# Altium project NewTrackerMain.PrjPcb (part 1 of 6)
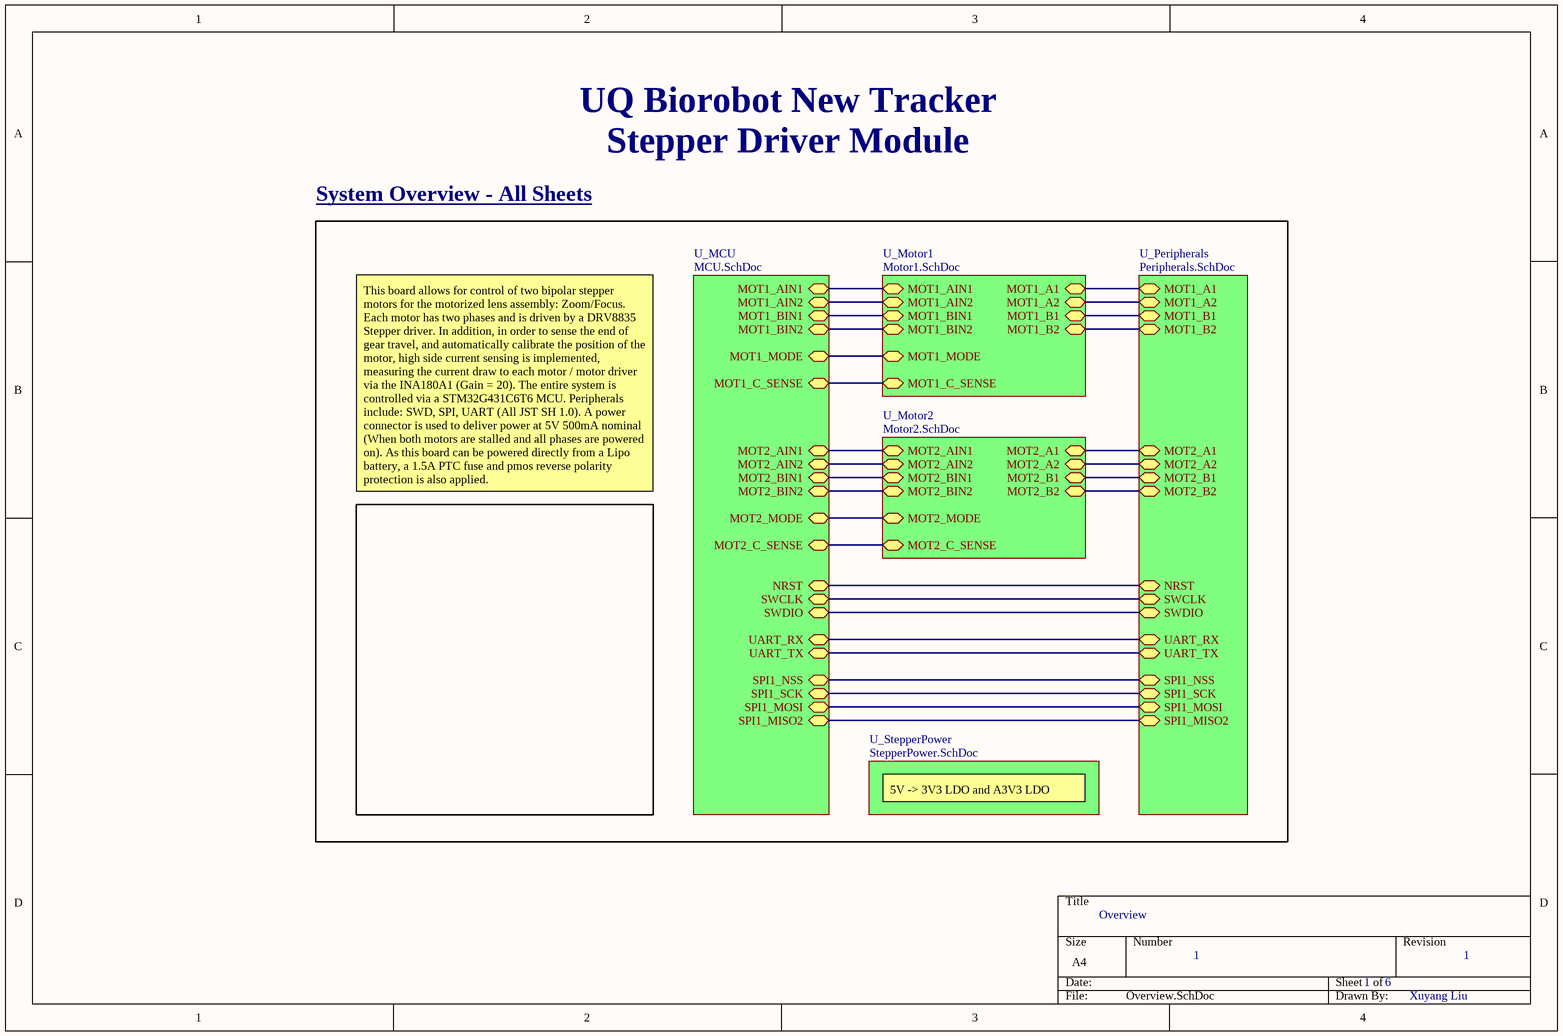
[diagram p0: Overview.SchDoc]
6 sheets, 68 parts. Net scope: hierarchical (ports join the sheet entries above them; power ports are global).
Board file: PCB2.PcbDoc
Sheets:
  Overview.SchDoc
    U_MCU = MCU.SchDoc
    U_Motor1 = Motor1.SchDoc
    U_Motor2 = Motor2.SchDoc
    U_Peripherals = Peripherals.SchDoc
    U_StepperPower = StepperPower.SchDoc

## Sheet Overview.SchDoc
size A4; SheetNumber: 1; SheetTotal: 6

### Sub-sheets
U_MCU = MCU.SchDoc: NRST (bidir), SPI1_SCK (bidir), SPI1_MOSI (bidir), SWDIO (bidir), SWCLK (bidir), UART_TX (bidir), UART_RX (bidir), SPI1_MISO2 (bidir), SPI1_NSS (bidir), MOT1_MODE (bidir), MOT1_AIN1 (bidir), MOT1_AIN2 (bidir), MOT1_BIN1 (bidir), MOT1_BIN2 (bidir), MOT2_AIN1 (bidir), MOT2_AIN2 (bidir), MOT2_BIN1 (bidir), MOT2_BIN2 (bidir), MOT2_MODE (bidir), MOT1_C_SENSE (bidir), MOT2_C_SENSE (bidir)
U_Motor1 = Motor1.SchDoc: MOT1_A1 (bidir), MOT1_A2 (bidir), MOT1_B1 (bidir), MOT1_B2 (bidir), MOT1_AIN1 (bidir), MOT1_AIN2 (bidir), MOT1_BIN1 (bidir), MOT1_BIN2 (bidir), MOT1_MODE (bidir), MOT1_C_SENSE (bidir)
U_Motor2 = Motor2.SchDoc: MOT2_A1 (bidir), MOT2_A2 (bidir), MOT2_B1 (bidir), MOT2_B2 (bidir), MOT2_AIN1 (bidir), MOT2_AIN2 (bidir), MOT2_BIN1 (bidir), MOT2_BIN2 (bidir), MOT2_MODE (bidir), MOT2_C_SENSE (bidir)
U_Peripherals = Peripherals.SchDoc: SWDIO (bidir), SWCLK (bidir), NRST (bidir), UART_TX (bidir), UART_RX (bidir), SPI1_NSS (bidir), SPI1_SCK (bidir), SPI1_MOSI (bidir), SPI1_MISO2 (bidir), MOT1_A1 (bidir), MOT1_A2 (bidir), MOT1_B1 (bidir), MOT1_B2 (bidir), MOT2_A1 (bidir), MOT2_A2 (bidir), MOT2_B1 (bidir), MOT2_B2 (bidir)
U_StepperPower = StepperPower.SchDoc: no entries

### Nets
MOT1_A1: sheet U_Motor1/MOT1_A1, sheet U_Peripherals/MOT1_A1
MOT1_A2: sheet U_Motor1/MOT1_A2, sheet U_Peripherals/MOT1_A2
MOT1_AIN1: sheet U_MCU/MOT1_AIN1, sheet U_Motor1/MOT1_AIN1
MOT1_AIN2: sheet U_MCU/MOT1_AIN2, sheet U_Motor1/MOT1_AIN2
MOT1_B1: sheet U_Motor1/MOT1_B1, sheet U_Peripherals/MOT1_B1
MOT1_B2: sheet U_Motor1/MOT1_B2, sheet U_Peripherals/MOT1_B2
MOT1_BIN1: sheet U_MCU/MOT1_BIN1, sheet U_Motor1/MOT1_BIN1
MOT1_BIN2: sheet U_MCU/MOT1_BIN2, sheet U_Motor1/MOT1_BIN2
MOT1_C_SENSE: sheet U_MCU/MOT1_C_SENSE, sheet U_Motor1/MOT1_C_SENSE
MOT1_MODE: sheet U_MCU/MOT1_MODE, sheet U_Motor1/MOT1_MODE
MOT2_A1: sheet U_Motor2/MOT2_A1, sheet U_Peripherals/MOT2_A1
MOT2_A2: sheet U_Motor2/MOT2_A2, sheet U_Peripherals/MOT2_A2
MOT2_AIN1: sheet U_MCU/MOT2_AIN1, sheet U_Motor2/MOT2_AIN1
MOT2_AIN2: sheet U_MCU/MOT2_AIN2, sheet U_Motor2/MOT2_AIN2
MOT2_B1: sheet U_Motor2/MOT2_B1, sheet U_Peripherals/MOT2_B1
MOT2_B2: sheet U_Motor2/MOT2_B2, sheet U_Peripherals/MOT2_B2
MOT2_BIN1: sheet U_MCU/MOT2_BIN1, sheet U_Motor2/MOT2_BIN1
MOT2_BIN2: sheet U_MCU/MOT2_BIN2, sheet U_Motor2/MOT2_BIN2
MOT2_C_SENSE: sheet U_MCU/MOT2_C_SENSE, sheet U_Motor2/MOT2_C_SENSE
MOT2_MODE: sheet U_MCU/MOT2_MODE, sheet U_Motor2/MOT2_MODE
NRST: sheet U_MCU/NRST, sheet U_Peripherals/NRST
SPI1_MISO2: sheet U_MCU/SPI1_MISO2, sheet U_Peripherals/SPI1_MISO2
SPI1_MOSI: sheet U_MCU/SPI1_MOSI, sheet U_Peripherals/SPI1_MOSI
SPI1_NSS: sheet U_MCU/SPI1_NSS, sheet U_Peripherals/SPI1_NSS
SPI1_SCK: sheet U_MCU/SPI1_SCK, sheet U_Peripherals/SPI1_SCK
SWCLK: sheet U_MCU/SWCLK, sheet U_Peripherals/SWCLK
SWDIO: sheet U_MCU/SWDIO, sheet U_Peripherals/SWDIO
UART_RX: sheet U_MCU/UART_RX, sheet U_Peripherals/UART_RX
UART_TX: sheet U_MCU/UART_TX, sheet U_Peripherals/UART_TX

### Notes on the sheet
- UQ Biorobot New Tracker
- Stepper Driver Module
- System Overview - All Sheets
- This board allows for control of two bipolar stepper motors for the motorized lens assembly: Zoom/Focus. Each motor has two phases and is driven by a DRV8835 Stepper driver. In addition, in order to sense the end of gear travel, and automatically calibrate the position of the motor, high side current sensing is implemented, measuring the current draw to each motor / motor driver via the INA180A1 (Gain = 20). The entire system is controlled via a STM32G431C6T6 MCU. Peripherals include: SWD, SPI, UART (All JST SH 1.0). A power connector is used to deliver power at 5V 500mA nominal (When both motors are stalled and all phases are powered on). As this board can be powered directly from a Lipo battery, a 1.5A PTC fuse and pmos reverse polarity protection is also applied.
- 5V -> 3V3 LDO and A3V3 LDO
- Overview
- 1
- 1     6
- Xuyang Liu